# EasyEDA Pro project ProPrj_轮腿机器人-世博同学-正式版.epro, schematic 双轮足AS5600
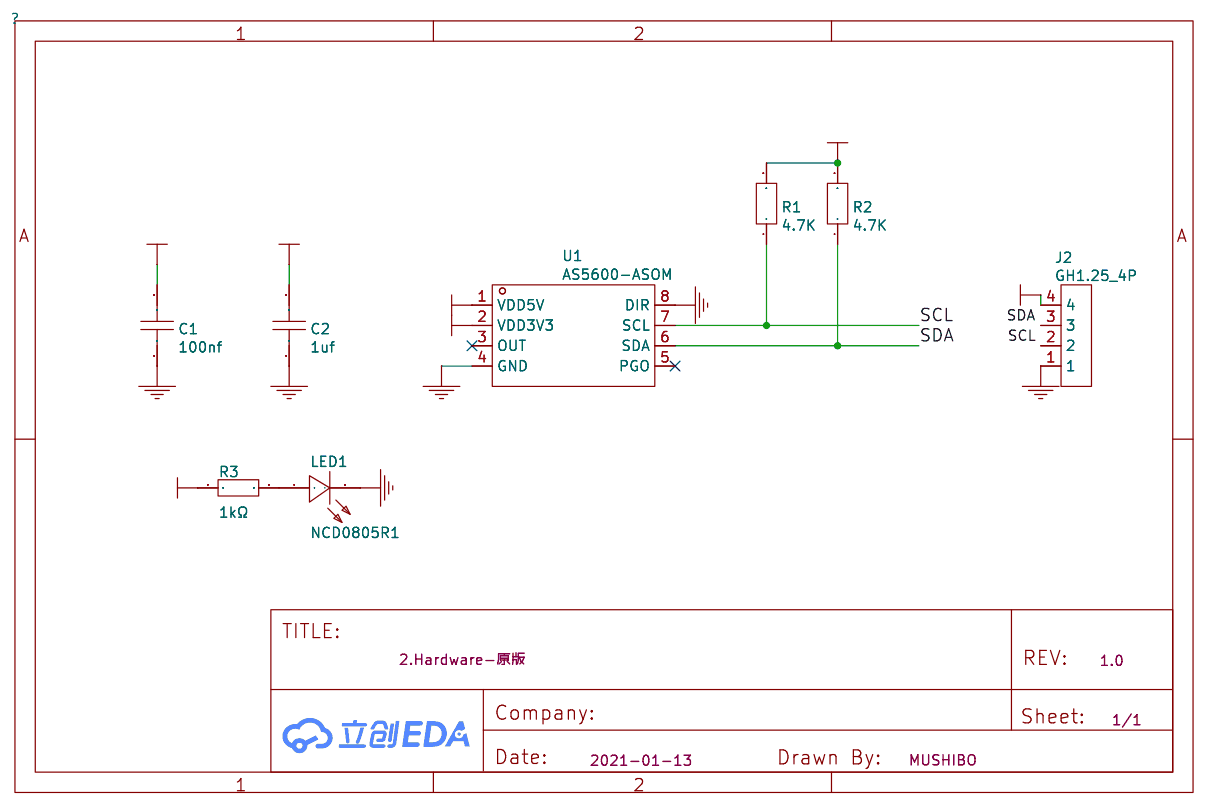
[diagram p2: schematic sheet]

## Parts
C1  100nf  [C0603]
C2  1uf  [C0603]
J2  GH1.25_4P  [GH1.25_4P_卧贴]
LED1  NCD0805R1  [LED0805-R-RD]
R1  4.7K  [R0603]
R2  4.7K  [R0603]
R3  1kΩ  [R0603]
U1  AS5600-ASOM  [SOIC-8_L5.0-W4.0-P1.27-LS6.0-BL]

## Library data of the parts
C1 = 100nf: link: https://item.szlcsc.com/362304.html; 3DModel: C0603_L1.6-W0.8-H0.8
C2 = 1uf: link: https://item.szlcsc.com/362304.html; 3DModel: C0603_L1.6-W0.8-H0.8
J2 = GH1.25_4P: 3DModel: CONN-SMD_GH1.25-WS-4P COPY; Manufacturer: Changjiang Connectors; Supplier: LCSC; Supplier Part: CC225131
LED1 = NCD0805R1: 灯头类型:-;发光颜色:红色;正向电压(VF):1.6V~2.6V;功率:65mW;正向电流:20mA;主波长:615nm~630nm;二极管配置:独立二极管;透镜颜色:无色透明透镜;色温:-;发光强度:67mcd~195mcd;发光角度:130°;载带方式:-;工作温度:-30℃~+85℃;; Supplier Part: C84256; Manufacturer: 国星光电; Supplier Footprint: 0805; JLCPCB Part Class: 基础库; Datasheet: https://atta.szlcsc.com/upload/public/pdf/source/20200820/C84256_F0A75A43B3EAD75808600A0514C76B99.pdf; Supplier: LCSC; Emitted Color: 红色; Forward Voltage (VF): 1.6V~2.6V; Power Dissipation: 65mW; Forward Current: 20mA; Dominant Wavelength: 615nm~630nm; Diode Configuration: 独立二极管; Lens Color: 无色透明透镜; Luminous Intensity: 67mcd~195mcd; Viewing Angle: 130°; Operating Temperature: -30℃~+85℃
R1 R2 = 4.7K: link: https://item.szlcsc.com/137208.html; 3DModel: R0603_L1.6-W0.8-H0.8
R3 = 0603WAF1001T5E: 电阻类型:厚膜电阻;阻值:1kΩ;精度:±1%;功率:100mW;最大工作电压:75V;温度系数:±100ppm/℃;; LCSC Part Name: 1kΩ ±1% 100mW 厚膜电阻; Supplier Part: C21190; Manufacturer: UNI-ROYAL(厚声); Supplier Footprint: 0603; JLCPCB Part Class: 基础库; Datasheet: https://atta.szlcsc.com/upload/public/pdf/source/20200306/C422600_1E6D84923E4A46A82E41ADD87F860B5C.pdf; Supplier: LCSC; Type: 厚膜电阻; Tolerance: ±1%; Power(Watts): 100mW; Overload Voltage (Max): 75V; Temperature Coefficient: ±100ppm/℃; Operating Temperature Range: -55℃~+155℃
U1 = AS5600-ASOM: link: https://item.szlcsc.com/417287.html; 3DModel: SOIC-8_L4.9-W3.9-H1.7-LS6.0-P1.27; Supplier: LCSC; Manufacturer: Ams; Supplier Part: C79815; JLCPCB Part Class: Extended Part; JLCPCB SMD: Yes

## Nets
GND: C1.1 C2.1 J2.1 LED1.2(-) U1.4(GND) U1.8(DIR)
VCC: C1.2 J2.4 R1.2 R2.2 R3.1 U1.1(VDD5V)
VCC3.3: C2.2 U1.2(VDD3V3)
SCL: J2.2 R1.1 U1.7(SCL)
SDA: J2.3 R2.1 U1.6(SDA)
$1N565: LED1.1(+) R3.2

Not connected (* = marked no-connect by the designer): U1 3(OUT)* 5(PGO)*
